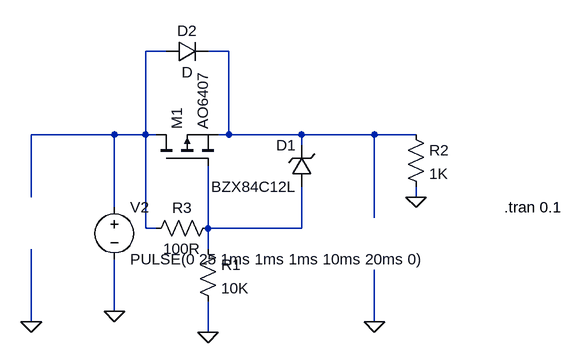
[diagram p0: schematic Draft1.asc]
Draft1.asc, the LTspice schematic file:
Version 4.1
SHEET 1 880 680
WIRE -80 -32 -112 -32
WIRE 16 -32 -16 -32
WIRE -160 96 -288 96
WIRE -112 96 -112 -32
WIRE -112 96 -160 96
WIRE -96 96 -112 96
WIRE 16 96 16 -32
WIRE 16 96 0 96
WIRE 128 96 16 96
WIRE 240 96 128 96
WIRE 304 96 240 96
WIRE 128 112 128 96
WIRE -288 192 -288 96
WIRE 304 192 304 176
WIRE -160 208 -160 96
WIRE 240 224 240 96
WIRE -112 240 -112 96
WIRE -96 240 -112 240
WIRE -16 240 -16 144
WIRE 128 240 128 176
WIRE 128 240 -16 240
WIRE -16 272 -16 240
WIRE -160 368 -160 288
WIRE -288 384 -288 272
WIRE 240 384 240 304
WIRE -16 400 -16 352
FLAG -16 400 0
FLAG -288 384 0
FLAG 304 192 0
FLAG 240 384 0
FLAG -160 368 0
SYMBOL pmos -96 144 R270
SYMATTR InstName M1
SYMATTR Value AO6407
SYMBOL zener 144 176 R180
WINDOW 0 24 64 Left 2
WINDOW 3 24 0 Left 2
SYMATTR InstName D1
SYMATTR Value BZX84C12L
SYMBOL res -32 256 R0
SYMATTR InstName R1
SYMATTR Value 10K
SYMBOL res 288 80 R0
SYMATTR InstName R2
SYMATTR Value 1K
SYMBOL voltage -160 192 R0
WINDOW 123 0 0 Left 0
WINDOW 39 0 0 Left 0
SYMATTR InstName V2
SYMATTR Value PULSE(0 25 1ms 1ms 1ms 10ms 20ms 0)
SYMBOL res 0 224 R90
WINDOW 0 0 56 VBottom 2
WINDOW 3 32 56 VTop 2
SYMATTR InstName R3
SYMATTR Value 100R
SYMBOL diode -80 -16 R270
WINDOW 0 32 32 VTop 2
WINDOW 3 0 32 VBottom 2
SYMATTR InstName D2
TEXT 440 208 Left 2 !.tran 0.1

The netlist it stands for:
* Draft1.asc
M1 N001 N003 N002 N002 AO6407
D1 N003 N002 BZX84C12L
R1 N003 0 10K
R2 N002 0 1K
V2 N001 0 PULSE(0 25 1ms 1ms 1ms 10ms 20ms 0)
R3 N003 N001 100R
D2 N001 N002 D
.model D D
.lib standard.dio
.model NMOS NMOS
.model PMOS PMOS
.lib standard.mos
.tran 0.1
.backanno
.end